# Altium project lighting_control_board.PrjPcb
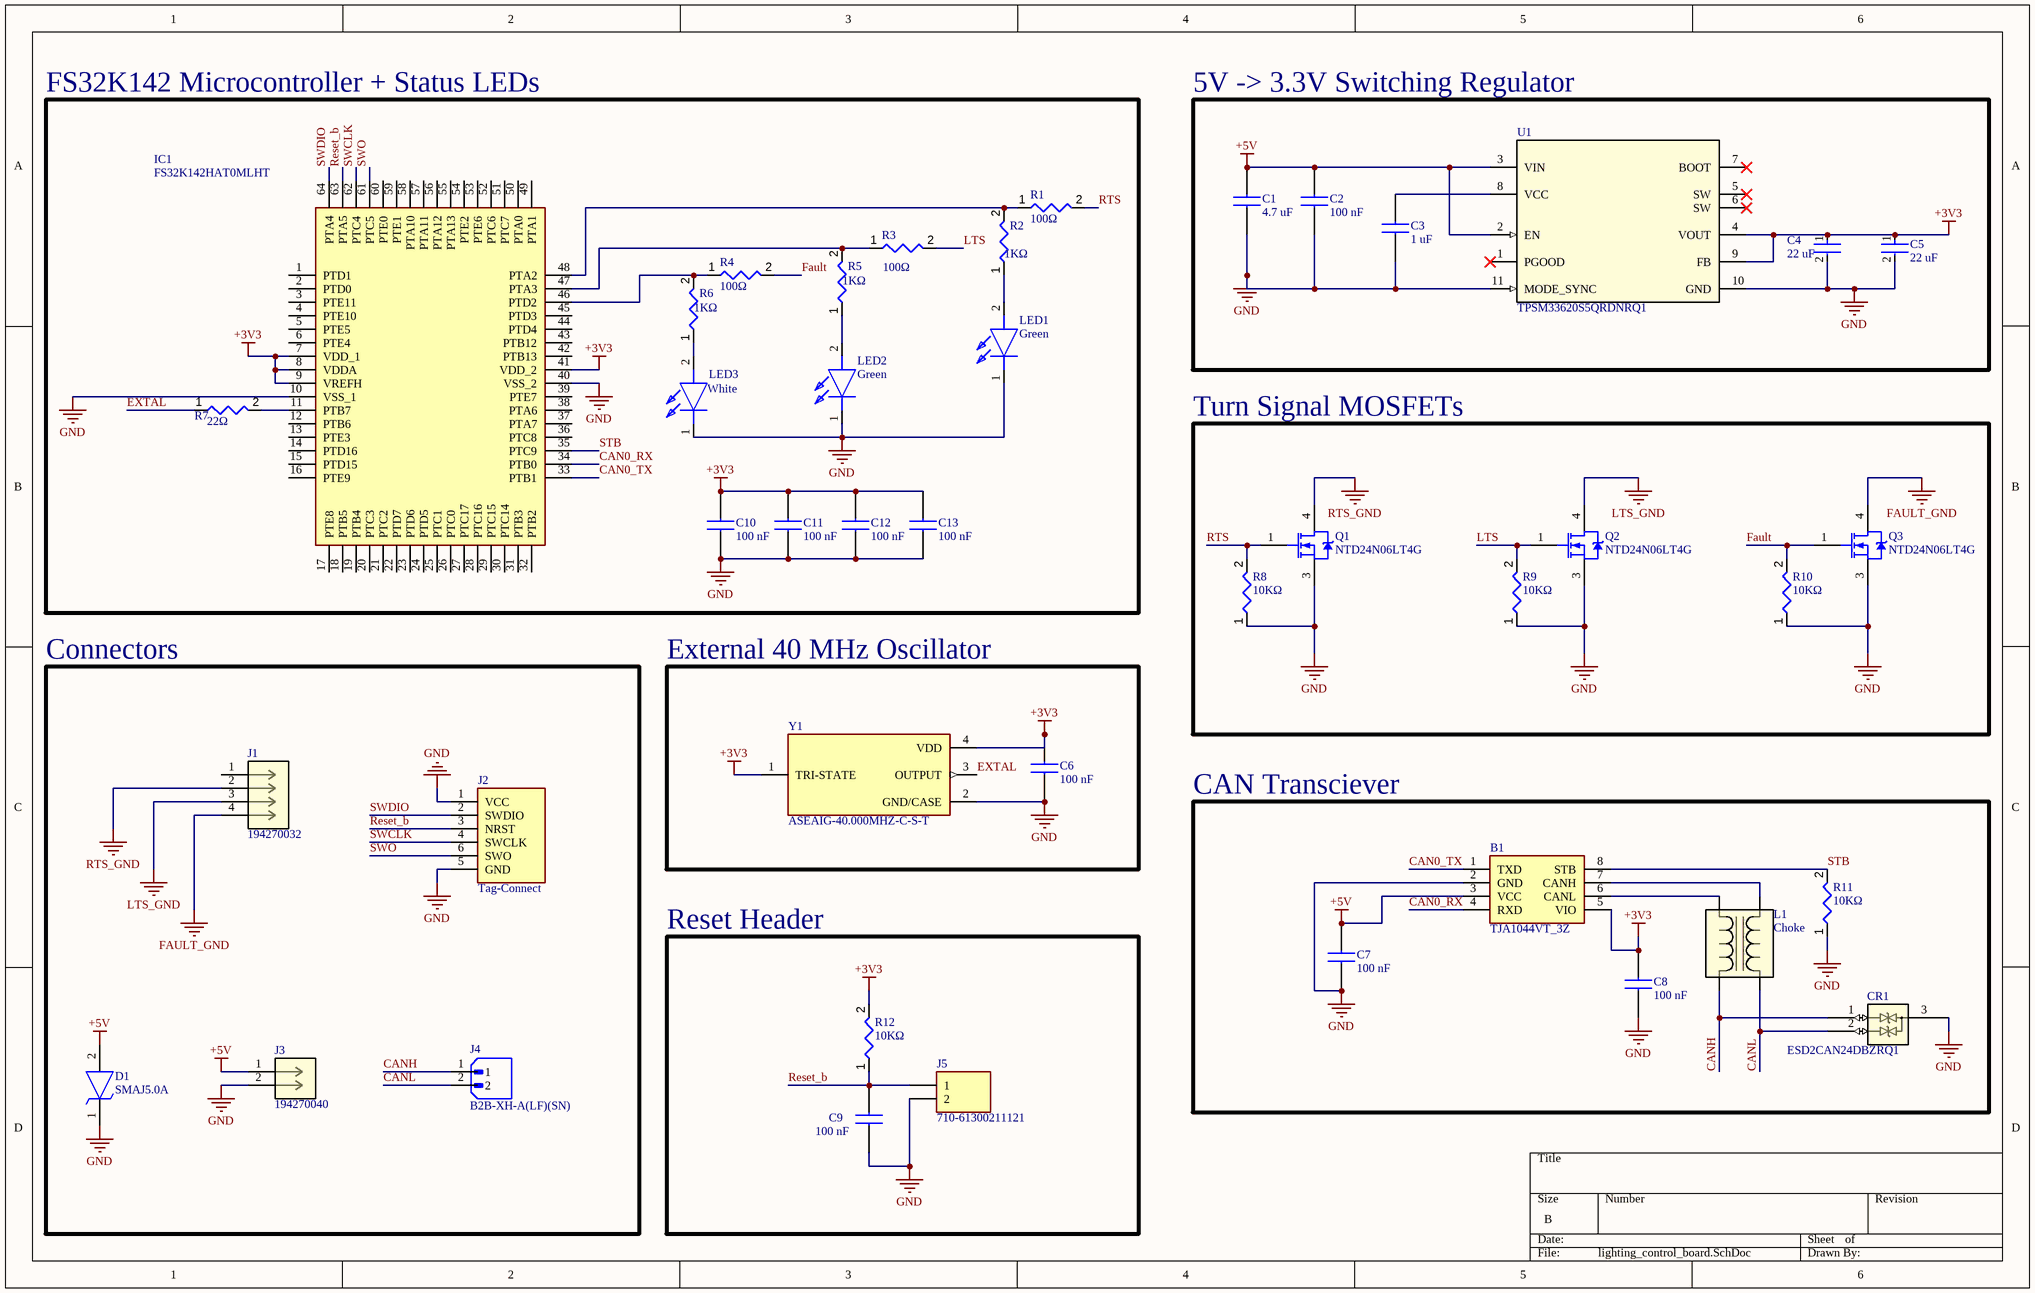
[diagram p0: lighting_control_board.SchDoc]
1 sheet, 43 parts. Net scope: global (net labels, ports and power ports of the same name join across sheets).

## Sheet lighting_control_board.SchDoc
size B; SheetNumber: 1; SheetTotal: 1

### Parts
B1  TJA1044VT_3Z  [SOIC127P600X175-8N]
C1  4.7 uF  [CAP_0603]
C2  100 nF  [CAP_0603]
C3  1 uF  [CAP_0603]
C4  22 uF  [FP-GRM188-0_2-IPC_C]
C5  22 uF  [FP-GRM188-0_2-IPC_C]
C6  100 nF  [CAP_0603]
C7  100 nF  [CAP_0603]
C8  100 nF  [CAP_0603]
C9  100 nF  [CAP_0603]
C10  100 nF  [CAP_0603]
C11  100 nF  [CAP_0603]
C12  100 nF  [CAP_0603]
C13  100 nF  [CAP_0603]
CR1  ESD2CAN24DBZRQ1  [SOT-23_DBZ_TEX]
D1  SMAJ5.0A  [DIOM5026X229N]
IC1  FS32K142HAT0MLHT  [QFP50P1200X1200X160-64N]
J1  194270032  [CONN_SD-19427-020_MOL]
J2  Tag-Connect  [TC2030-MCP]
J3  194270040  [CONN_SD-19427-018_MOL]
J4  B2B-XH-A(LF)(SN)  [JST_B2B-XH-A(LF)(SN)]
J5  710-61300211121  [HDRV2W110P0X254_1X2_508X254X854P]
L1  Choke  [ACT1210_TDK]
LED1  Green  [LEDC2012X90N]
LED2  Green  [LEDC2012X90N]
LED3  White  [LEDC2012X90N]
Q1  NTD24N06LT4G  [ONSC-DPAK-3-369C-01_V]
Q2  NTD24N06LT4G  [ONSC-DPAK-3-369C-01_V]
Q3  NTD24N06LT4G  [ONSC-DPAK-3-369C-01_V]
R1  100Ω  [RES_0603]
R2  1KΩ  [RES_0603]
R3  100Ω  [RES_0603]
R4  100Ω  [RES_0603]
R5  1KΩ  [RES_0603]
R6  1KΩ  [RES_0603]
R7  22Ω  [RES_0603]
R8  10KΩ  [RES_0603]
R9  10KΩ  [RES_0603]
R10  10KΩ  [RES_0603]
R11  10KΩ  [RES_0603]
R12  10KΩ  [RES_0603]
U1  TPSM33620S5QRDNRQ1  [RDN0011B-MFG]
Y1  ASEAIG-40.000MHZ-C-S-T  [XTAL_ASEAIG-40.000MHZ-C-S-T]

### Blocks framed on the sheet
FS32K142 Microcontroller + Status LEDs: C10-C13 IC1 LED1-LED3 R1-R7
5V -> 3.3V Switching Regulator: C1-C5 U1
Turn Signal MOSFETs: Q1-Q3 R8-R10
Connectors: D1 J1-J4
External 40 MHz Oscillator: C6 Y1
CAN Transciever: B1 C7 C8 CR1 L1 R11
Reset Header: C9 J5 R12

### Nets
+3V3: B1.5(VIO) C4.1 C5.1 C6.1 C8.2 C10.1 C11.1 C12.1 C13.1 IC1.7(VDD_1) IC1.8(VDDA) IC1.9(VREFH) IC1.41(VDD_2) R12.2 U1.4(VOUT) U1.9(FB) Y1.1(TRI-STATE) Y1.4(VDD)
+5V: B1.3(VCC) C1.2 C2.2 C7.2 D1.2(A) J3.1 U1.2(EN) U1.3(VIN)
FAULT_GND: J1.4 Q3.4(D)
GND: B1.2(GND) C1.1 C2.1 C3.1 C4.2 C5.2 C6.2 C7.1 C8.1 C9.2 C10.2 C11.2 C12.2 C13.2 CR1.3 D1.1(K) IC1.10(VSS_1) IC1.40(VSS_2) J2.1(VCC) J2.5(GND) J3.2 J5.2 LED1.1(K) LED2.1(K) LED3.1(K) Q1.3(S) Q2.3(S) Q3.3(S) R8.1 R9.1 R10.1 R11.1 U1.10(GND) U1.11(MODE_SYNC) Y1.2(GND/CASE)
LTS_GND: J1.3 Q2.4(D)
RTS_GND: J1.2 Q1.4(D)
CAN0_RX: B1.4(RXD) IC1.34(PTB0)
CAN0_TX: B1.1(TXD) IC1.33(PTB1)
CANH: CR1.1 J4.1 L1.1
CANL: CR1.2 J4.2 L1.2
EXTAL: R7.1 Y1.3(OUTPUT)
Fault: Q3.1(G) R4.2 R10.2
LTS: Q2.1(G) R3.2 R9.2
Reset_b: C9.1 IC1.63(PTA5) J2.3(NRST) J5.1 R12.1
RTS: Q1.1(G) R1.2 R8.2
STB: B1.8(STB) IC1.35(PTC9) R11.2
SWCLK: IC1.62(PTC4) J2.4(SWCLK)
SWDIO: IC1.64(PTA4) J2.2(SWDIO)
SWO: IC1.61(PTC5) J2.6(SWO)
NetB1_6: B1.6(CANL) L1.4
NetB1_7: B1.7(CANH) L1.3
NetC3_2: C3.2 U1.8(VCC)
NetIC1_11: IC1.11(PTB7) R7.2
NetIC1_46: IC1.46(PTD2) R4.1 R6.2
NetIC1_47: IC1.47(PTA3) R3.1 R5.2
NetIC1_48: IC1.48(PTA2) R1.1 R2.2
NetLED1_2: LED1.2(A) R2.1
NetLED2_2: LED2.2(A) R5.1
NetLED3_2: LED3.2(A) R6.1

Not connected (* = marked no-connect by the designer): IC1 1(PTD1) 2(PTD0) 3(PTE11) 4(PTE10) 5(PTE5) 6(PTE4) 12(PTB6) 13(PTE3) 14(PTD16) 15(PTD15) 16(PTE9) 17(PTE8) 18(PTB5) 19(PTB4) 20(PTC3) 21(PTC2) 22(PTD7) 23(PTD6) 24(PTD5) 25(PTC1) 26(PTC0) 27(PTC17) 28(PTC16) 29(PTC15) 30(PTC14) 31(PTB3) 32(PTB2) 36(PTC8) 37(PTA7) 38(PTA6) 39(PTE7) 42(PTB13) 43(PTB12) 44(PTD4) 45(PTD3) 49(PTA1) 50(PTA0) 51(PTC7) 52(PTC6) 53(PTE6) 54(PTE2) 55(PTA13) 56(PTA12) 57(PTA11) 58(PTA10) 59(PTE1) 60(PTE0); J1 1; U1 1(PGOOD)* 5(SW)* 6(SW)* 7(BOOT)*

### Library data of the parts
B1 = TJA1044VT_3Z: CAN Interface IC HS-CAN Transceivers High-speed CAN transceiver with Standby mode; Manufacturer_Name: NXP; Manufacturer_Part_Number: TJA1044VT/3Z; Geometry.Height: 1.75mm; Mouser Part Number: 771-TJA1044VT/3Z; Mouser Price/Stock: https://www.mouser.co.uk/ProductDetail/NXP-Semiconductors/TJA1044VT-3Z?qs=wUXugUrL1qwONZrxXTzMPQ%3D%3D; Datasheet Link: http://www.nxp.com/docs/en/data-sheet/TJA1044V.pdf
C1 = 4.7 uF Capacitor, 0603: Multilayer Ceramic Capacitors MLCC - SMD/SMT KGM15BR71H224JT NEW GLOBAL PN 50V 0.22uF A 581-KGM15BR71H224JT; Manufacturer 1: KYOCERA AVX; Manufacturer Part Number 1: 06033D475KAT2A; MPN: 581-06033D475KAT2A; Tolerance: 10%; Voltage: 25 V; Value: 4.7 uF; Package: 0603; Library Ref: Capacitor_BASE; Design Item ID: 4.7 uF Capacitor, 0603; Supplier 1: Mouser
C2 C6-C13 = 100 nF Capacitor, 0603: Multilayer Ceramic Capacitors MLCC - SMD/SMT KGM15BR71H104JT NEW GLOBAL PN 50V 0.1uF A 581-KGM15BR71H104JT; Manufacturer 1: KYOCERA AVX; Manufacturer Part Number 1: 06035C104JAT2A; MPN: 581-06035C104JAT2A; Tolerance: 5%; Value: 100 nF; Voltage: 50 V; Package: 0603; Library Ref: Capacitor_BASE; Design Item ID: 100 nF Capacitor, 0603; Supplier 1: Mouser
C3 = 1 uF Capacitor, 0603: Multilayer Ceramic Capacitors MLCC - SMD/SMT KGM15BR71H224JT NEW GLOBAL PN 50V 0.22uF A 581-KGM15BR71H224JT; Manufacturer 1: KYOCERA AVX; Manufacturer Part Number 1: 06033C105KAT2A; MPN: 581-06033C105KAT2A; Tolerance: 10%; Voltage: 25 V; Value: 1 uF; Package: 0603; Library Ref: Capacitor_BASE; Design Item ID: 1 uF Capacitor, 0603; Supplier 1: Mouser
C4 C5 = CMP-2000-06337-3: Chip Multilayer Ceramic Capacitors for General Purpose, 0603, 22uF, X5R, 15%, 20%, 10V; Tolerance: 20%; Weight: 0.000222oz; Material: Ceramic; Depth: 0.8mm; Length: 1.6mm; Termination: SMD/SMT; Capacitance: 22uF; Packaging: Tape and Reel; Width: 0.8mm; Voltage Rating: 10V; Case Code (Imperial): 0603; Mount: Surface Mount; Voltage Rating (DC): 10V; Case/Package: 0603; Thickness: 0.039inch; REACH SVHC: No SVHC; Dielectric: X5R; Height: 0.8mm; Package Quantity: 4000; Case Code (Metric): 1608; Min Operating Temperature: -55°C; Lead Free: Lead Free; Max Operating Temperature: 85°C
CR1 = ESD2CAN24DBZRQ1: Automotive, dual, 3-pF, Â±24-V, Â±30-kV ESD protection diode for in-vehicle networks 3-SOT-23 -55 to 150; Manufacturer_Name: Texas Instruments; Copyright: Copyright (C) 2026 Ultra Librarian. All rights reserved.; Manufacturer_Part_Number: ESD2CAN24DBZRQ1; RefDes: RefDes; Type: Type
D1 = SMAJ5.0A: TVS +5 V rail; Manufacturer_Name: LITTELFUSE; Datasheet Link: https://www.littelfuse.com/~/media/electronics/datasheets/tvs_diodes/littelfuse_tvs_diode_smaj_datasheet.pdf.pdf; Height: 2.29mm; Manufacturer_Part_Number: SMAJ5.0A; Mouser Part Number: 576-SMAJ5.0A; Mouser Price/Stock: https://www.mouser.co.uk/ProductDetail/Littelfuse/SMAJ5.0A?qs=2VFNtWizgicfetZVA4gWHA%3D%3D; Arrow Part Number: SMAJ5.0A; Arrow Price/Stock: https://www.arrow.com/en/products/smaj5-0a_12/littelfuse.html?utm_currency=USD&region=nac
IC1 = FS32K142HAT0MLHT: Integrated Circuit; Manufacturer_Name: NXP; Datasheet Link: https://datasheet.datasheetarchive.com/originals/distributors/DKDS42/DSANUWW0047967.pdf; Height: 1.6mm; Manufacturer_Part_Number: FS32K142HAT0MLHT; Mouser Part Number: 771-FS32K142HAT0MLHT; Mouser Price/Stock: https://www.mouser.co.uk/ProductDetail/NXP-Semiconductors/FS32K142HAT0MLHT?qs=W0yvOO0ixfHOt6NwcnDRUQ%3D%3D; Arrow Part Number: FS32K142HAT0MLHT; Arrow Price/Stock: https://www.arrow.com/en/products/fs32k142hat0mlht/nxp-semiconductors?region=nac
J1 = 194270032: 5.84mm Pitch MX150L Right-Angle PCB Header, Dual Row, without PCB Flange, Tin Plated, 4 Circuits; Manufacturer_Name: Molex Connector Corporation; Copyright: Copyright (C) 2026 Ultra Librarian. All rights reserved.; Manufacturer_Part_Number: 194270032; RefDes: RefDes; Type: Type
J2 = Tag-Connect: Tag-Connect Programming Connector
J3 = 194270040: 5.84mm Pitch MX150L Right-Angle PCB Header, Single Row, without PCB Flange, Tin Plated, 2 Circuits; Manufacturer_Name: Molex Connector Corporation; Copyright: Copyright (C) 2026 Ultra Librarian. All rights reserved.; Manufacturer_Part_Number: 194270040; RefDes: RefDes; Type: Type
J4 = B2B-XH-A(LF)(SN): Connector Header Through Hole 2 position 0.098 (2.50mm); MF: JST Sales; SnapEDA_Link: https://www.snapeda.com/parts/B2B-XH-A(LF)(SN)/JST/view-part/?ref=snap; Package: None; Value: *; MP: B2B-XH-A(LF)(SN); Check_prices: https://www.snapeda.com/parts/B2B-XH-A(LF)(SN)/JST/view-part/?ref=eda
J5 = 61300211121: 2-Pin Header; Manufacturer_Name: Wurth Elektronik; Datasheet Link: https://www.we-online.com/components/products/datasheet/61300211121.pdf; Manufacturer_Part_Number: 61300211121; Supplier 1: Mouser; Supplier Part Number 1: 710-61300211121
L1 = ACT1210D-101-2P-TL00: Description; Manufacturer_Name: TDK; Type: Common Mode Chokes; Copyright: Copyright (C) 2025 Ultra Librarian. All rights reserved.; Manufacturer_Part_Number: ACT1210D-101-2P-TL00
LED1 LED2 = HSMW-C170-U0000_2: LED Green; Manufacturer_Name: Avago Technologies; Datasheet Link: https://componentsearchengine.com/Datasheets/2/HSMW-C170-U0000.pdf; Manufacturer_Part_Number: HSMW-C170-U0000; Supplier 1: Mouser; Supplier Part Number 1: 630-HSMQ-C170-T0000
LED3 = HSMW-C170-U0000_3: LED White; Manufacturer_Name: Avago Technologies; Datasheet Link: https://componentsearchengine.com/Datasheets/2/HSMW-C170-U0000.pdf; Manufacturer_Part_Number: HSMW-C170-U0000; Supplier 1: Mouser; Supplier Part Number 1: 630-HSMW-C170-U0000
Q1-Q3 = CMP-1058-00417-1: Power MOSFET, 24 A, 60 V, Logic Level, N-Channel, 3-Pin DPAK, Pb-Free, Tape and Reel; Manufacturer: On Semiconductor; Ciss Typ (pF): 814; VGS(th) Max (V): 2; Crss Typ (pF): 80; Channel Polarity: N Channel; Qrr Typ (nC): 84; Configuration: Single; Coss Typ (pF): 258; V(BR)DSS Min (V): 60; ComponentLink3URL: http://www.onsemi.cn/pub_link/Collateral/369C.PDF; PackageDescription: 3-Pin Flange Mount, Body 6.54 x 6.095 mm, Pitch 2.29 mm; ComponentLink1Description: Manufacturer URL; Mounting Technology: Surface Mount; ComponentLink1URL: http://www.onsemi.com/; ComponentLink2Description: Datasheet; RoHS: Pb-Free; Packing: Tape and Reel; DatasheetVersion: Rev. 3; ComponentLink2URL: http://www.onsemi.cn/pub_link/Collateral/NTD24N06L-D.PDF; Package Type: DPAK-3; ComponentLink3Description: Package Specification; PartNumber: NTD24N06LT4G; PackageReference: DPAK-3-369C-01; PackageVersion: Rev. E, 02/2014
R1 R3 R4 = 100 Ohm Resistor: Thick Film Resistors - SMD General Purpose Chip Resistor 0603, 100Ohms, 1%, 1/10W; Manufacturer 1: YAGEO; Manufacturer Part Number 1: RC0603FR-07100RL; MPN: 603-RC0603FR-07100RL; Tolerance: 0.01; Power: 0.1W; Value: 100Ω; Package: 0603; Library Ref: Resistor_BASE; Design Item ID: 100 Ohm Resistor; Supplier 1: Mouser
R2 R5 R6 = 1 KOhm Resistor: Thick Film Resistors - SMD General Purpose Chip Resistor 0603, 1kOhms, 1%, 1/10W; Manufacturer 1: YAGEO; Manufacturer Part Number 1: RC0603FR-071KL; MPN: 603-RC0603FR-071KL; Tolerance: 0.01; Power: 0.1W; Value: 1KΩ; Package: 0603; Library Ref: Resistor_BASE; Design Item ID: 1 KOhm Resistor; Supplier 1: Mouser
R7 = 22 Ohm Resistor: Thick Film Resistors - SMD General Purpose Chip Resistor 0603, 22Ohms, 1%, 1/10W; Manufacturer 1: YAGEO; Manufacturer Part Number 1: RC0603FR-0722RL; MPN: 603-RC0603FR-0722RL; Tolerance: 0.01; Power: 0.1W; Value: 22Ω; Package: 0603; Library Ref: Resistor_BASE; Design Item ID: 22 Ohm Resistor; Supplier 1: Mouser
R8-R12 = 10 KOhm Resistor: Thick Film Resistors - SMD General Purpose Chip Resistor 0603, 10kOhms, 1%, 1/10W; Manufacturer 1: YAGEO; Manufacturer Part Number 1: RC0603FR-0710KL; MPN: 603-RC0603FR-0710KL; Tolerance: 0.01; Power: 0.1W; Value: 10KΩ; Package: 0603; Library Ref: Resistor_BASE; Design Item ID: 10 KOhm Resistor; Supplier 1: Mouser
U1 = TPSM33620S5QRDNRQ1: Automotive, 3V to 36V input, 2A synchronous buck module 11-QFN-FCMOD -40 to 150; Manufacturer_Name: Texas Instruments; TYPE: TYPE; RefDes: RefDes; Copyright: Copyright (C) 2026 Ultra Librarian. All rights reserved.; Manufacturer_Part_Number: TPSM33620S5QRDNRQ1
Y1 = ASEAIG-40.000MHZ-C-S-T: 40 MHz XO (Standard) CMOS Oscillator 3.3V Enable/Disable 4-SMD, No Lead; MF: Abracon LLC; SnapEDA_Link: https://www.snapeda.com/parts/ASEAIG-40.000MHZ-C-S-T/Abracon+LLC/view-part/?ref=snap; Package: None; Value: *; MP: ASEAIG-40.000MHZ-C-S-T; Check_prices: https://www.snapeda.com/parts/ASEAIG-40.000MHZ-C-S-T/Abracon+LLC/view-part/?ref=eda